# Altium schematic sheet 000_HIERARCHICAL.SchDoc: HIERARCHICAL
size A4; Date: 23/10/2026; DrawnBy: Santiago Londoño; SheetNumber: 0; SheetTotal: 8
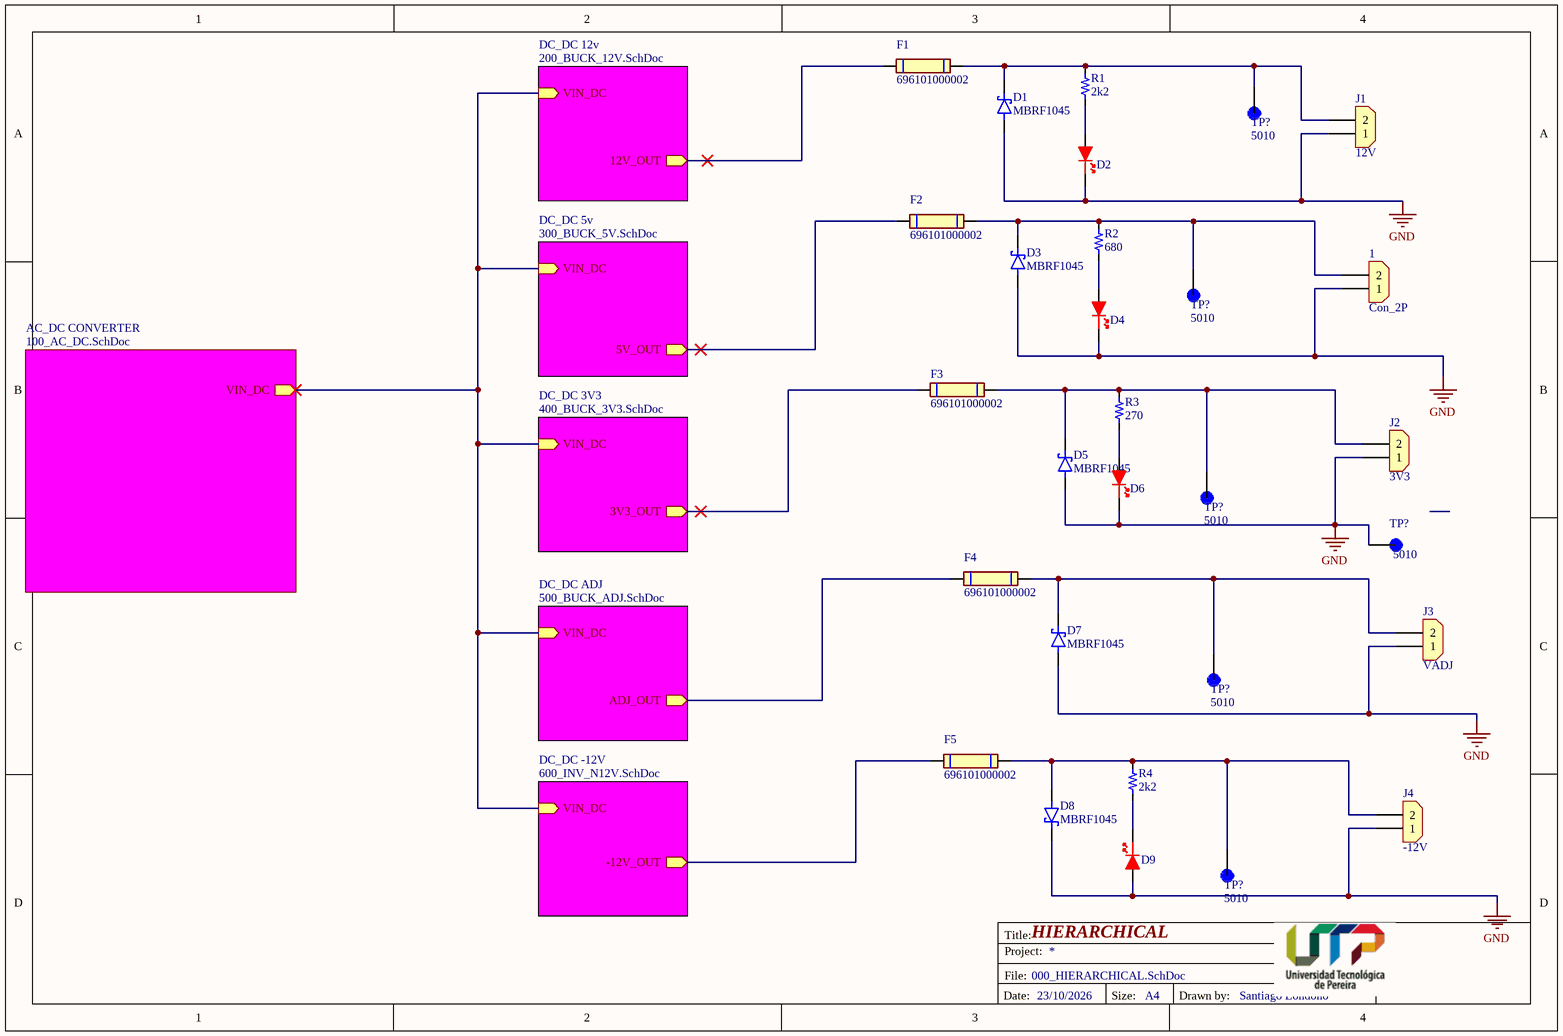
[diagram p0: 000_HIERARCHICAL.SchDoc]

## Parts
(Parts that share a designator on the sheet are numbered #1, #2 ... from top to bottom, then left to right.)
1  Con_2P  [CON_2x1_TH_3.5mm_TB]
D1  MBRF1045  [TO508P995X450X1960-2]
D2  LED  [LED_5MM]  (value not drawn)
D3  MBRF1045  [TO508P995X450X1960-2]
D4  LED  [LED_5MM]  (value not drawn)
D5  MBRF1045  [TO508P995X450X1960-2]
D6  LED  [LED_5MM]  (value not drawn)
D7  MBRF1045  [TO508P995X450X1960-2]
D8  MBRF1045  [TO508P995X450X1960-2]
D9  LED  [LED_5MM]  (value not drawn)
F1  696101000002  [696101000002]
F2  696101000002  [696101000002]
F3  696101000002  [696101000002]
F4  696101000002  [696101000002]
F5  696101000002  [696101000002]
J1  12V  [CON_2x1_TH_3.5mm_TB]
J2  3V3  [CON_2x1_TH_3.5mm_TB]
J3  VADJ  [CON_2x1_TH_3.5mm_TB]
J4  -12V  [CON_2x1_TH_3.5mm_TB]
R1  value 2k2  [0603]  (hidden comment: 2k2 1/10W)
R2  value 680  [0603]  (hidden comment: 2k2 1/10W)
R3  value 270  [0603]  (hidden comment: 2k2 1/10W)
R4  value 2k2  [0603]  (hidden comment: 2k2 1/10W)
TP?#1  5010  [TP_5010]
TP?#2  5010  [TP_5010]
TP?#3  5010  [TP_5010]
TP?#4  5010  [TP_5010]
TP?#5  5010  [TP_5010]
TP?#6  5010  [TP_5010]

## Sub-sheets
AC_DC CONVERTER = 100_AC_DC.SchDoc: VIN_DC (out)
DC_DC 3V3 = 400_BUCK_3V3.SchDoc: VIN_DC (in), 3V3_OUT (out)
DC_DC 5v = 300_BUCK_5V.SchDoc: VIN_DC (in), 5V_OUT (out)
DC_DC 12v = 200_BUCK_12V.SchDoc: VIN_DC (in), 12V_OUT (out)
DC_DC -12V = 600_INV_N12V.SchDoc: VIN_DC (in), -12V_OUT (out)
DC_DC ADJ = 500_BUCK_ADJ.SchDoc: VIN_DC (in), ADJ_OUT (out)

## Nets
GND: 1.1 D1.2(A) D2.K D3.2(A) D4.K D5.2(A) D6.K D7.2(A) D8.1(K) D9.A J1.1 J2.1 J3.1 J4.1 TP?#4.TP
Net1_2: 1.2 D3.1(K) F2.2 R2.2 TP?#2.TP
NetD1_1: D1.1(K) F1.2 J1.2 R1.2 TP?#1.TP
NetD2_A: D2.A R1.1
NetD4_A: D4.A R2.1
NetD5_1: D5.1(K) F3.1 J2.2 R3.2 TP?#3.TP
NetD6_A: D6.A R3.1
NetD7_1: D7.1(K) F4.2 J3.2 TP?#5.TP
NetD8_2: D8.2(A) F5.2 J4.2 R4.2 TP?#6.TP
NetD9_K: D9.K R4.1
NetF1_1: F1.1 ; sheet DC_DC 12v/12V_OUT
NetF2_1: F2.1 ; sheet DC_DC 5v/5V_OUT
NetF3_2: F3.2 ; sheet DC_DC 3V3/3V3_OUT
NetF4_1: F4.1 ; sheet DC_DC ADJ/ADJ_OUT
NetF5_1: F5.1 ; sheet DC_DC -12V/-12V_OUT
(unnamed): sheet AC_DC CONVERTER/VIN_DC, sheet DC_DC 12v/VIN_DC, sheet DC_DC 5v/VIN_DC, sheet DC_DC 3V3/VIN_DC, sheet DC_DC ADJ/VIN_DC, sheet DC_DC -12V/VIN_DC

## Notes on the sheet
- Title:
- Project:
- File:
- Revision:
- Date:
- Size:
- A4
- Drawn by:

## Library data of the parts
1 J1-J4 = Con_2x1_TH_3.5mm: TERM BLK 2POS SIDE ENT 3.5MM PCB; Manufacturer: Würth Elektronik; Manufacturer Part Number: 691214110002; Supplier 1: Digi-Key; Supplier Part Number 1: 732-2747-ND; Last modified by: J.Jaramillo; Last modified date: 20240310; ComponentLink1Description: Digi-key; ComponentLink1URL: https://www.digikey.com/product-detail/en/wurth-electronics-inc/691214110002/732-2747-ND/2508516; Reel Stock: N/A
D2 D4 D6 D9 = LED_5MM_GENERIC_THT: 5mm LED Generic THT
F1-F5 = 696101000002: MF: {'manufacturer': u'W\xfcrth Elektronik'}; Package: None; Price: None; Value: *; MP: 696101000002; Availability: Unavailable
R1-R4 = Res_2k2_0603_1/10W: RES SMD 2.2K OHM 1% 1/10W 0603; Manufacturer: Yageo; Manufacturer Part Number: RC0603FR-072K2L; Reel Stock: N/A; Last modified by: J.Jaramillo; Last modified date: 20240310; ComponentLink1Description: Digi-Key; ComponentLink1URL: https://www.digikey.com/en/products/detail/yageo/RC0603FR-072K2L/727016?s=N4IgTCBcDaIEoGEAMA2JBmAYnAtEg7GANJgAyIAugL5A; Supplier 1: Digi-Key; Supplier Part Number 1: 311-2.20KHRCT-ND
TP?#1-TP?#6 = 5010: Test Point MultiPurpose THM .445 L .125 OD Heat Resistant Nylon 46 Red | Keystone Electronics 5010; SnapEDA_Link: https://www.snapeda.com/parts/5010/Keystone/view-part/?ref=snap; Package: NON STANDARD-1 Keystone; Value: *; MF: Keystone Electronics; MP: 5010; Check_prices: https://www.snapeda.com/parts/5010/Keystone/view-part/?ref=eda
D1 D3 D5 D7 D8 = MBRF1045: Availability: Unavailable; Value: *; Package: None; MP: MBRF1045; Price: None